# Altium schematic sheet 05.Motor_Drive.schdoc: 05.Motor_Drive
size A4; Revision: V2.0; SheetNumber: 5; SheetTotal: 5; Project: TC264
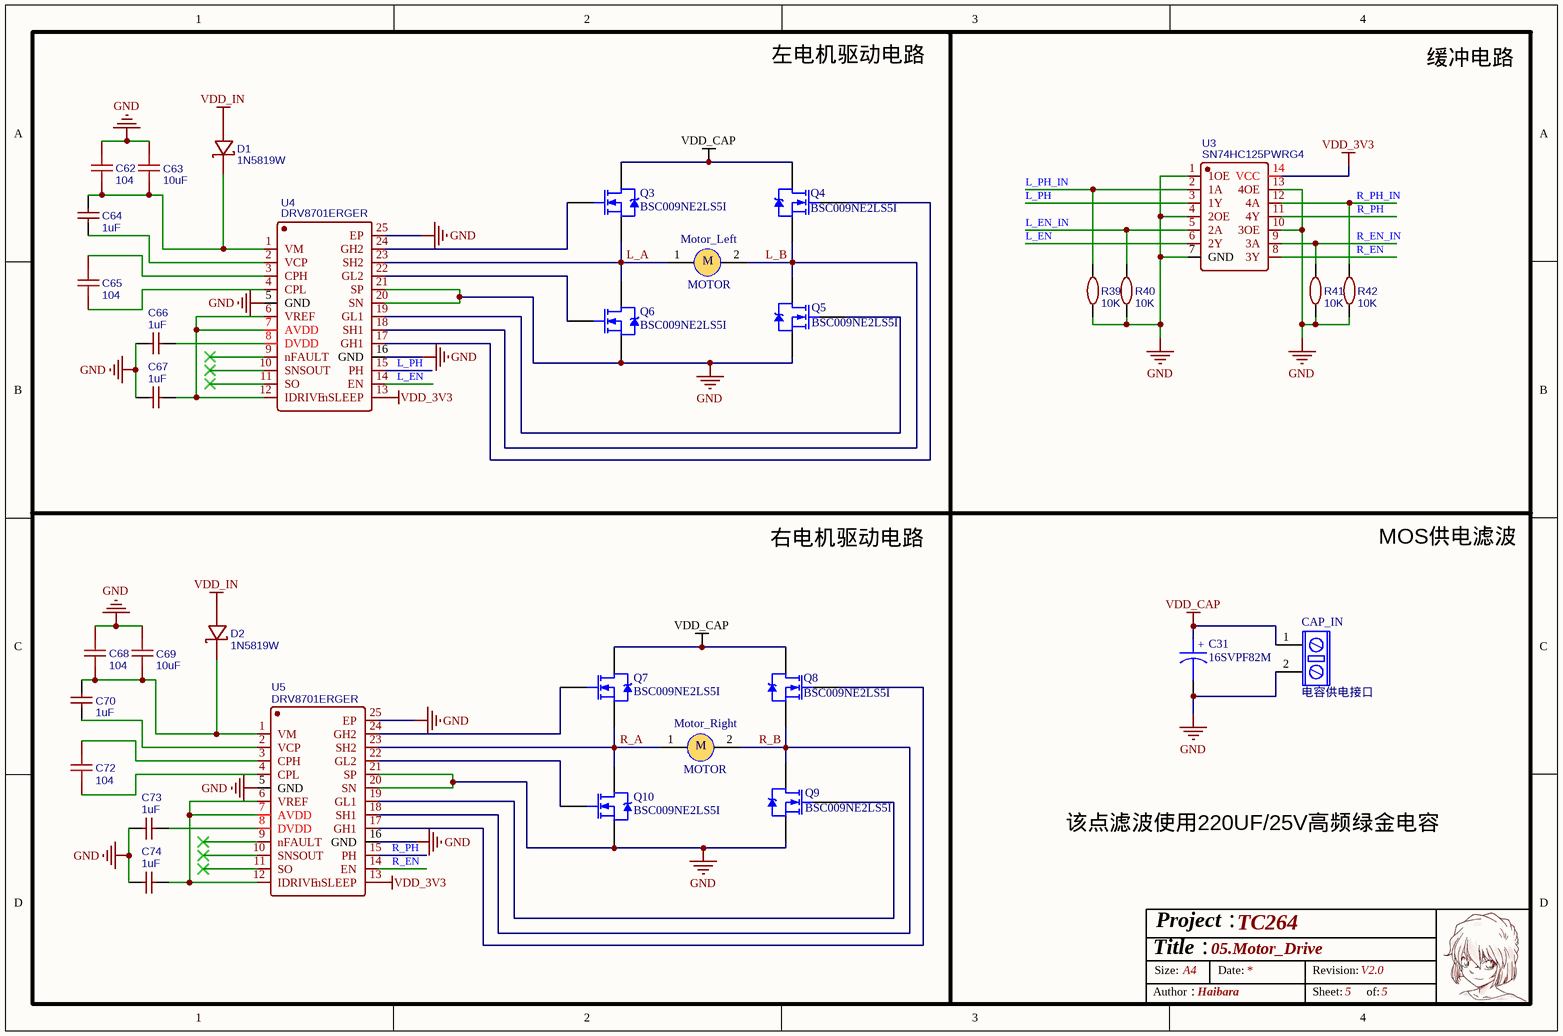
[diagram p0: 05.Motor_Drive.schdoc]

## Parts
C31  16SVPF82M  [CAP 2.5*6.3*11.2]
C62  104  [C0603]
C63  10uF  [C0805]
C64  1uF  [C0603]
C65  104  [C0603]
C66  1uF  [C0603]
C67  1uF  [C0603]
C68  104  [C0603]
C69  10uF  [C0805]
C70  1uF  [C0603]
C72  104  [C0603]
C73  1uF  [C0603]
C74  1uF  [C0603]
CAP_IN  电容供电接口  [5.08 2P 螺钉端子]
D1  1N5819W  [SOD-123F_L2.8-W1.8-LS3.7-RD]
D2  1N5819W  [SOD-123F_L2.8-W1.8-LS3.7-RD]
Motor_Left  MOTOR  [XT30 母头 电源插头]
Motor_Right  MOTOR  [XT30 母头 电源插头]
Q3  BSC009NE2LS5I  [PSON-8 MOS]
Q4  BSC009NE2LS5I  [PSON-8 MOS]
Q5  BSC009NE2LS5I  [PSON-8 MOS]
Q6  BSC009NE2LS5I  [PSON-8 MOS]
Q7  BSC009NE2LS5I  [PSON-8 MOS]
Q8  BSC009NE2LS5I  [PSON-8 MOS]
Q9  BSC009NE2LS5I  [PSON-8 MOS]
Q10  BSC009NE2LS5I  [PSON-8 MOS]
R39  10K  [R0603]
R40  10K  [R0603]
R41  10K  [R0603]
R42  10K  [R0603]
U3  SN74HC125PWRG4  [TSSOP-14_L5.0-W4.4-P0.65-LS6.4-TL]
U4  DRV8701ERGER  [VQFN-24_L4.0-W4.0-P0.50-BL-EP2.8]
U5  DRV8701ERGER  [VQFN-24_L4.0-W4.0-P0.50-BL-EP2.8]

## Nets
GND: C31.2 C62.2 C63.1 C66.2 C67.2 C68.2 C69.1 C73.2 C74.2 CAP_IN.2 Q5.1(S) Q6.1(S) Q9.1(S) Q10.1(S) R39.1 R40.1 R41.1 R42.1 U3.1(1OE) U3.4(2OE) U3.7(GND) U3.10(3OE) U3.13(4OE) U4.5(GND) U4.16(GND) U4.20(SN) U4.21(SP) U4.25(EP) U5.5(GND) U5.16(GND) U5.20(SN) U5.21(SP) U5.25(EP)
VDD_3V3: U3.14(VCC) U4.13(nSLEEP) U5.13(nSLEEP)
VDD_CAP: C31.1 CAP_IN.1 Q3.3(D) Q4.3(D) Q7.3(D) Q8.3(D)
VDD_IN: D1.2 D2.2
L_A: Motor_Left.1 Q3.1(S) Q6.3(D) U4.23(SH2)
L_B: Motor_Left.2 Q4.1(S) Q5.3(D) U4.18(SH1)
L_EN: U3.6(2Y) U4.14(EN)
L_EN_IN: R40.2 U3.5(2A)
L_PH: U3.3(1Y) U4.15(PH)
L_PH_IN: R39.2 U3.2(1A)
R_A: Motor_Right.1 Q7.1(S) Q10.3(D) U5.23(SH2)
R_B: Motor_Right.2 Q8.1(S) Q9.3(D) U5.18(SH1)
R_EN: U3.8(3Y) U5.14(EN)
R_EN_IN: R41.2 U3.9(3A)
R_PH: U3.11(4Y) U5.15(PH)
R_PH_IN: R42.2 U3.12(4A)
NetC62_1: C62.1 C63.2 C64.2 D1.1 U4.1(VM)
NetC64_1: C64.1 U4.2(VCP)
NetC65_1: C65.1 U4.4(CPL)
NetC65_2: C65.2 U4.3(CPH)
NetC66_1: C66.1 U4.8(DVDD)
NetC67_1: C67.1 U4.6(VREF) U4.7(AVDD) U4.12(IDRIVE)
NetC68_1: C68.1 C69.2 C70.2 D2.1 U5.1(VM)
NetC70_1: C70.1 U5.2(VCP)
NetC72_1: C72.1 U5.4(CPL)
NetC72_2: C72.2 U5.3(CPH)
NetC73_1: C73.1 U5.8(DVDD)
NetC74_1: C74.1 U5.6(VREF) U5.7(AVDD) U5.12(IDRIVE)
NetQ3_2: Q3.2(G) U4.24(GH2)
NetQ4_2: Q4.2(G) U4.17(GH1)
NetQ5_2: Q5.2(G) U4.19(GL1)
NetQ6_2: Q6.2(G) U4.22(GL2)
NetQ7_2: Q7.2(G) U5.24(GH2)
NetQ8_2: Q8.2(G) U5.17(GH1)
NetQ9_2: Q9.2(G) U5.19(GL1)
NetQ10_2: Q10.2(G) U5.22(GL2)

Not connected (* = marked no-connect by the designer): U4 9(nFAULT)* 10(SNSOUT)* 11(SO)*; U5 9(nFAULT)* 10(SNSOUT)* 11(SO)*

## Notes on the sheet
- 左电机驱动电路
- 缓冲电路
- 右电机驱动电路
- MOS供电滤波
- 该点滤波使用220UF/25V高频绿金电容
- Title：
- Size:
- Project：
- A4
- Date:
- Revision:
- Author：
- Haibara
- Sheet:
- of:
- (in symbol CAP POL) +
- (in symbol MOTOR1) M

## Library data of the parts
C31 = CAP POL: Capacitor
C62 C65 C68 C72 = 0.1u: nameAlias: Value(F); Contributor: LCEDA_Lib; spicePre: C; spiceSymbolName: C_0603_US
C63 C69 = 10uF: BOM_Manufacturer: Huaxin S&T; BOM_Manufacturer Part: 0805F106Z160CT; nameAlias: Capacitance; Contributor: LCSC; BOM_Supplier: LCSC; BOM_Supplier Part: C303921; BOM_JLCPCB Part Class: Extended Part; spicePre: C; spiceSymbolName: 0805F106Z160CT
C64 C66 C67 C70 C73 C74 = 1uF: BOM_Manufacturer Part: CL10B105KO8NNNC; BOM_Manufacturer: SAMSUNG; nameAlias: Capacitance; BOM_Supplier: LCSC; BOM_Supplier Part: C59782; BOM_JLCPCB Part Class: Extended Part; spicePre: C; spiceSymbolName: CL10B105KO8NNNC
CAP_IN = 电机供电接口
D1 D2 = 1N5819W: BOM_Manufacturer: Shandong Jingdao Microelectronics; Contributor: LCSC; BOM_Supplier: LCSC; BOM_Supplier Part: C169540; BOM_Manufacturer Part: 1N5819W; BOM_JLCPCB Part Class: Extended Part; spicePre: D; spiceSymbolName: 1N5819W
Motor_Left Motor_Right = MOTOR1
Q3-Q10 = NMOS: N-Channel Power MOSFET 40V 100A 1.8mΩ; Note: Pin 2 is electrically connected to pin 4.; Published: 8-Jun-2000; LatestRevisionDate: 17-Jul-2002; LatestRevisionNote: Re-released for DXP Platform.; DatasheetVersion: PD-9.814; PackageVersion: Feb-1997; PackageReference: TO-220AB; Publisher: Altium Limited; PackageDescription: TO, Thru-Hole, Vertical, Heatsink Mounted; 3 In-Line Leads; Pitch 2.54 mm; ComponentLink1Description: Manufacturer Link; ComponentLink1URL: http://www.irf.com/
R39-R42 = 10K: BOM_Manufacturer: YAGEO; BOM_Manufacturer Part: RT0603BRD0710KL; nameAlias: Resistance (Ohms); Resistance: 10kΩ; BOM_Supplier: LCSC; BOM_Supplier Part: C95204; BOM_JLCPCB Part Class: Extended Part; spicePre: R; spiceSymbolName: RT0603BRD0710KL
U3 = SN74HC125PWRG4: BOM_Manufacturer: TI(德州仪器); Contributor: LCSC; BOM_Supplier: LCSC; BOM_Supplier Part: C2676184; BOM_Manufacturer Part: SN74HC125PWRG4; BOM_JLCPCB Part Class: Extended Part; spicePre: U; spiceSymbolName: SN74HC125PWRG4
U4 U5 = DRV8701ERGER: BOM_Manufacturer: Texas Instruments; Contributor: LCSC; BOM_Supplier: LCSC; BOM_Supplier Part: C90964; BOM_Manufacturer Part: DRV8701ERGER; BOM_JLCPCB Part Class: Extended Part; spicePre: U; spiceSymbolName: DRV8701ERGER